# Altium schematic sheet 1_masterconnections.SchDoc: PC/104 Board Template
size 431 x 279 mm; ItemRevision: 1; Date: 11/09/2026; CheckedBy: JYW; DrawnBy: JYW; Engineer: JYW; Organization: Liquid Rocketry @ Illinois; DocumentNumber: N/A; Revision: A; SheetNumber: 1; SheetTotal: 1; SCH_SCALE: N/A
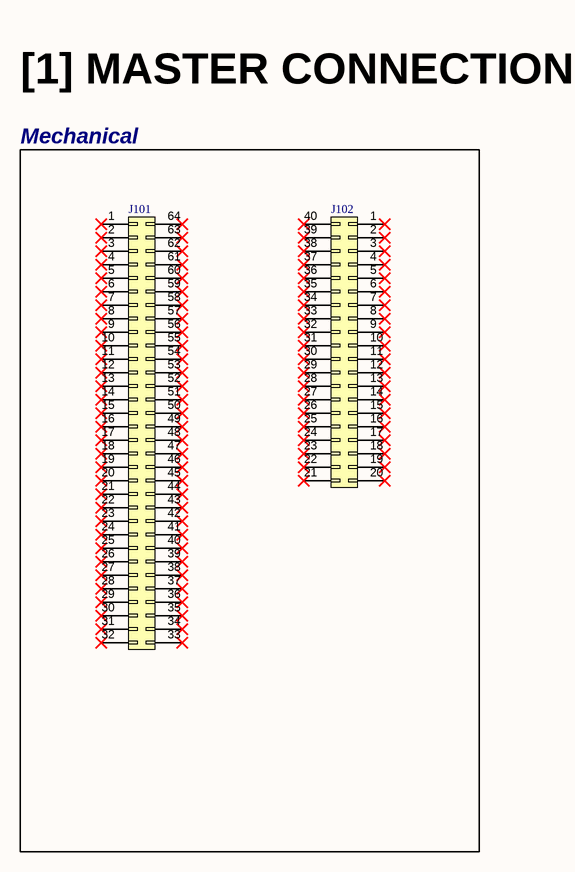
[diagram p0: 1_masterconnections.SchDoc]

## Parts
J101  SAMTEC_ESQ-132-14-G-D  (value not drawn)  (mechanical)
J102  SAMTEC_ESQ-120-14-G-D_1  (value not drawn)  (mechanical)

## Nets

Not connected (* = marked no-connect by the designer): J101 1* 2* 3* 4* 5* 6* 7* 8* 9* 10* 11* 12* 13* 14* 15* 16* 17* 18* 19* 20* 21* 22* 23* 24* 25* 26* 27* 28* 29* 30* 31* 32* 33* 34* 35* 36* 37* 38* 39* 40* 41* 42* 43* 44* 45* 46* 47* 48* 49* 50* 51* 52* 53* 54* 55* 56* 57* 58* 59* 60* 61* 62* 63* 64*; J102 1* 2* 3* 4* 5* 6* 7* 8* 9* 10* 11* 12* 13* 14* 15* 16* 17* 18* 19* 20* 21* 22* 23* 24* 25* 26* 27* 28* 29* 30* 31* 32* 33* 34* 35* 36* 37* 38* 39* 40*

## Notes on the sheet
- [1] MASTER CONNECTIONS
- Mechanical
- DWG. NO.
- REV.
- SHT.
- THIS DOCUMENT AND THE DATA CONTAINED HEREIN ARE THE PROPERTY OF LIQUID ROCKETRY AT ILLINOIS AND ARE INTENDED FOR INTERNAL TEAM USE ONLY. DO NOT DISTRIBUTE OUTSIDE THE ORGANIZATION WITHOUT WRITTEN PERMISSION FROM TEAM LEADERSHIP.
- REVISION
- DESCRIPTION
- DATE
- APPROVED
- ENG:
- APPROVALS
- PROJECT
- 104 S Wright St
- Talbot Laboratory
- DSN:
- CHK:
- REFERENCE DOCUMENTS
- BOARD NO.
- TITLE
- Urbana, IL 61801
- BOARD REFERENCE
- BOM:
- FAB DWG:
- PCB DWG:
- ASSY DWG:
- SCALE:
- SIZE
- B
- DWG NO.
- FILE NAME
- SHEET
- OF
- REV

## Library data of the parts
J101 = CMP-002-00072-1: .100in/2.54mm Elevated Socket Strip Receptacle Square Tail, 64 Pin, 2 Row, 20µin Gold/Flash, .435in Ht, .480in Tail; Manufacturer: Samtec; Manufacturer Lifecycle Status: PRODUCTION; Connector Type: Receptacle, Socket; Pitch: 2.54mm; Contact Resistance: 10mO; Number of Contacts: 64; Voltage Rating: 550V; Current Rating: 6.9A; Manufacturer Part Number: ESQ-132-14-G-D; Max Operating Temperature: 125°C; Housing Material: Polyester; Min Operating Temperature: -55°C; Housing Color: Black; Mounting Technology: Through Hole; Color: Black; Pins: 64; Design Item ID: SAMTEC_ESQ-132-14-G-D; Row Spacing: 2.54mm; Radiation Hardening: No; Category: Board to Board Connectors; Orientation: Vertical; Contact Plating: Gold; REACH SVHC: Unaffected; Termination: Solder; Number of Positions: 64; Number of Rows: 2; Contact Material: Bronze; Depth: 4.95mm; Max Current Rating: 6.9A; RoHS: Compliant; Source: lri_symbols.SchLib; Gender: Receptacle; Length: 81.79mm; Component Type: Mechanical
J102 = CMP-002-00071-1: .100in/2.54mm Elevated Socket Strip Receptacle Square Tail, 40 Pin, 2 Row, 20µin Gold/Flash, .435in Ht, .480in Tail; Manufacturer Lifecycle Status: PRODUCTION; Manufacturer: Samtec; Manufacturer Part Number: ESQ-120-14-G-D-LL-020; Number of Positions: 40; Connector Type: Receptacle, Socket; Row Spacing: 2.54mm; Contact Resistance: 10mO; Current Rating: 6.9A; Voltage Rating: 550V; Contact Material: Bronze; Color: Black; Pins: 40; RoHS: Compliant; Depth: 4.95mm; Mounting Technology: Through Hole; Gender: Receptacle; Min Operating Temperature: -55°C; Lifecycle Status: Production; Number of Rows: 2; Component Type: Mechanical; Pitch: 2.54mm; Housing Material: Polyester; Source: lri_symbols.SchLib; Max Operating Temperature: 125°C; Radiation Hardening: No; Termination: Solder; Length: 81.79mm; Number of Contacts: 40; Housing Color: Black; Contact Plating: Gold; REACH SVHC: Unaffected; Category: Board to Board Connectors; Design Item ID: SAMTEC_ESQ-120-14-G-D_1; Max Current Rating: 6.9A; Orientation: Vertical